# EasyEDA Pro project 电脑鼠_数字量最终方案.eprj, board PCB1
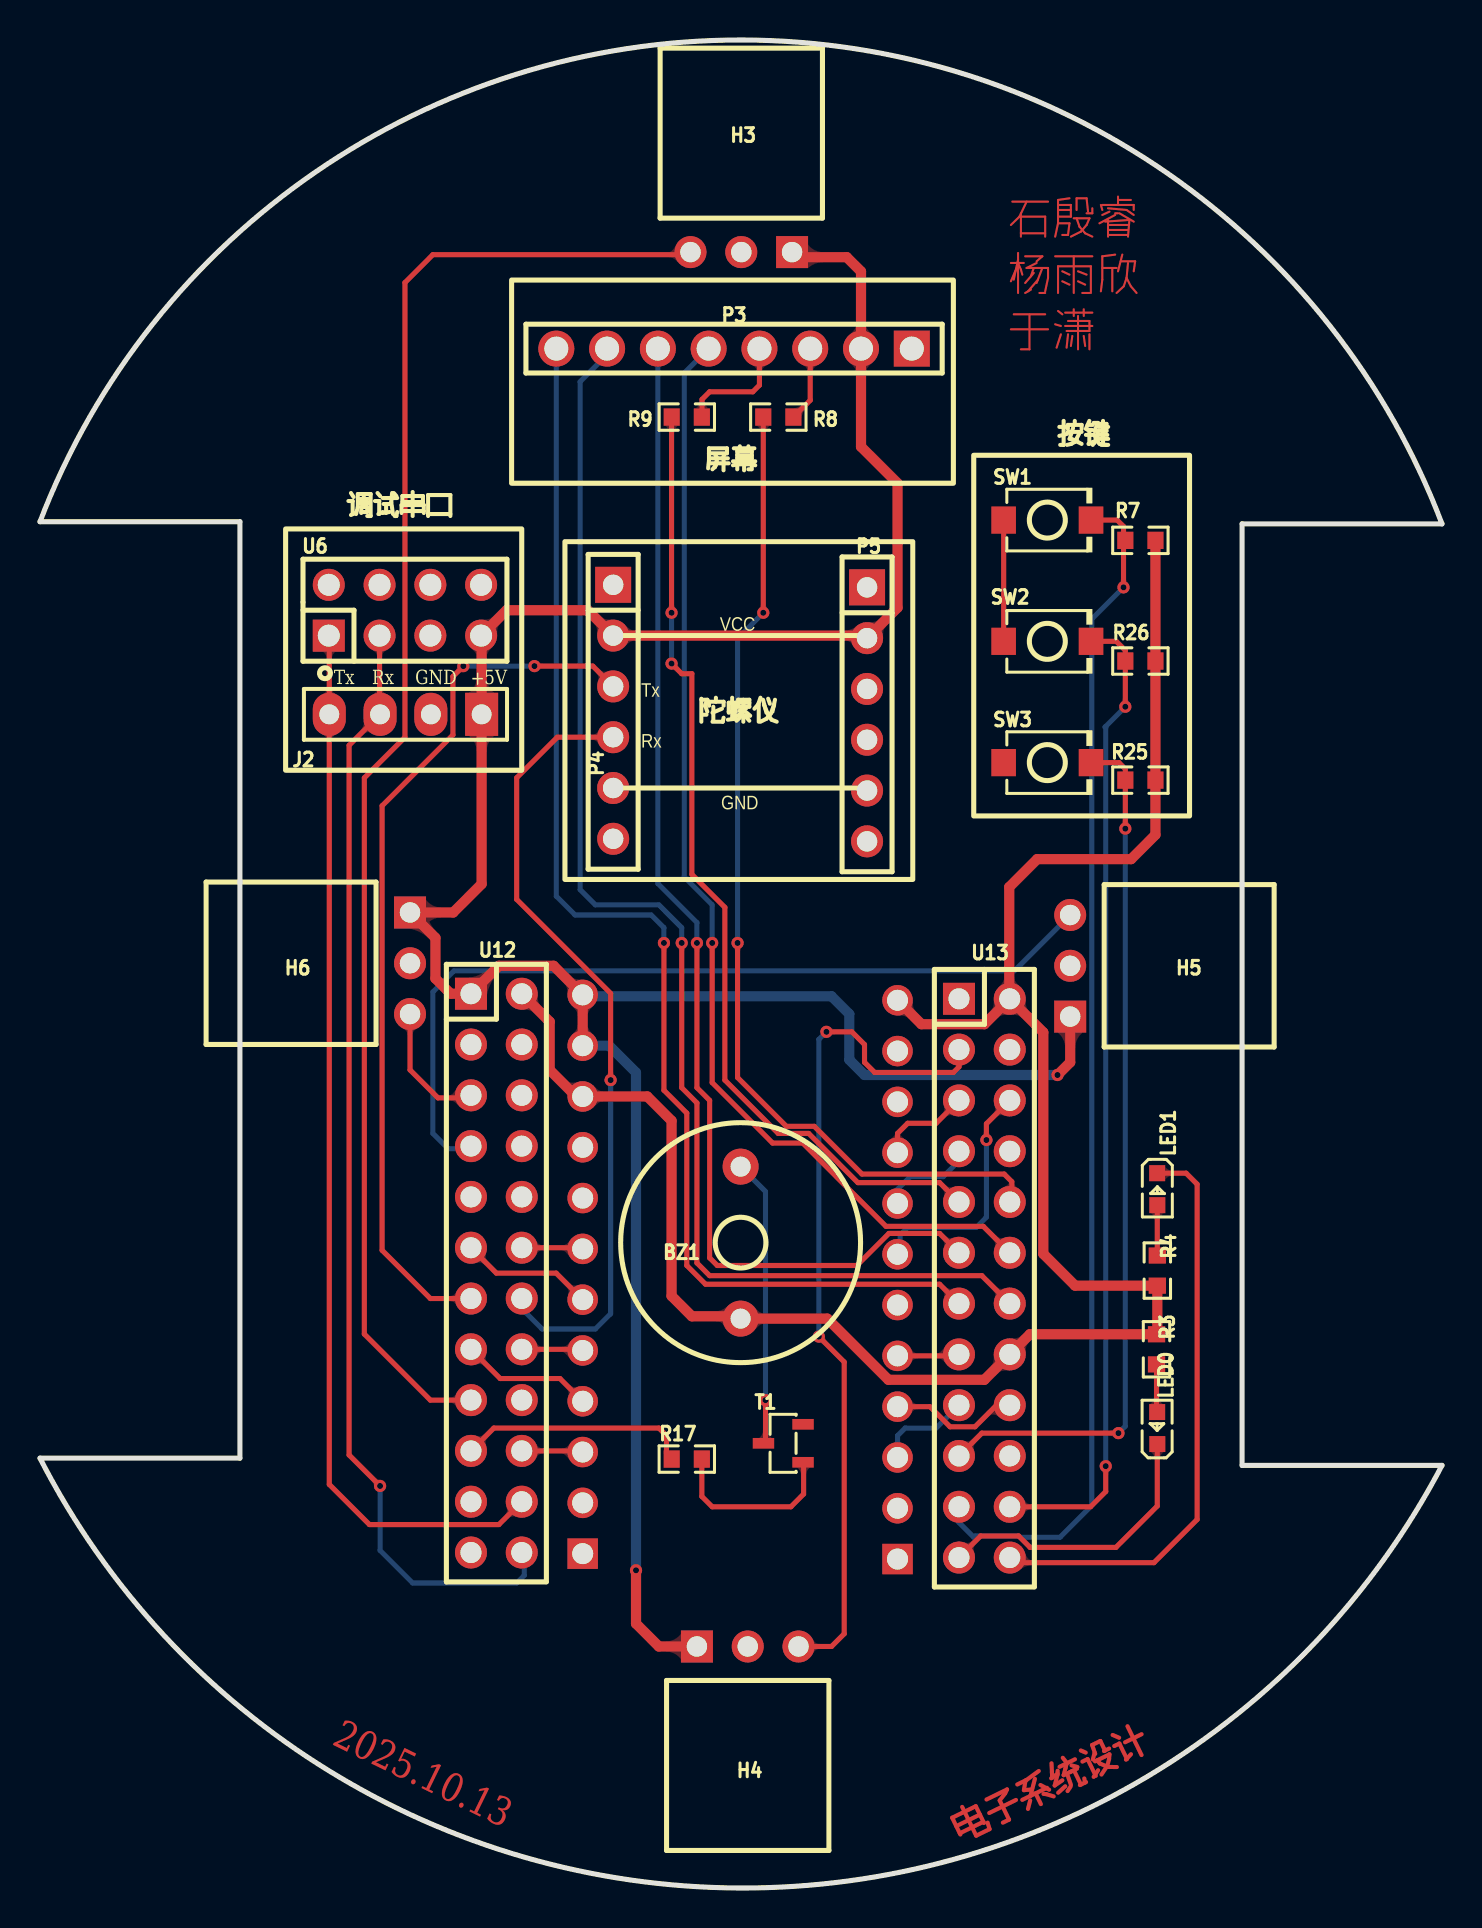
[diagram p2: board, top side]
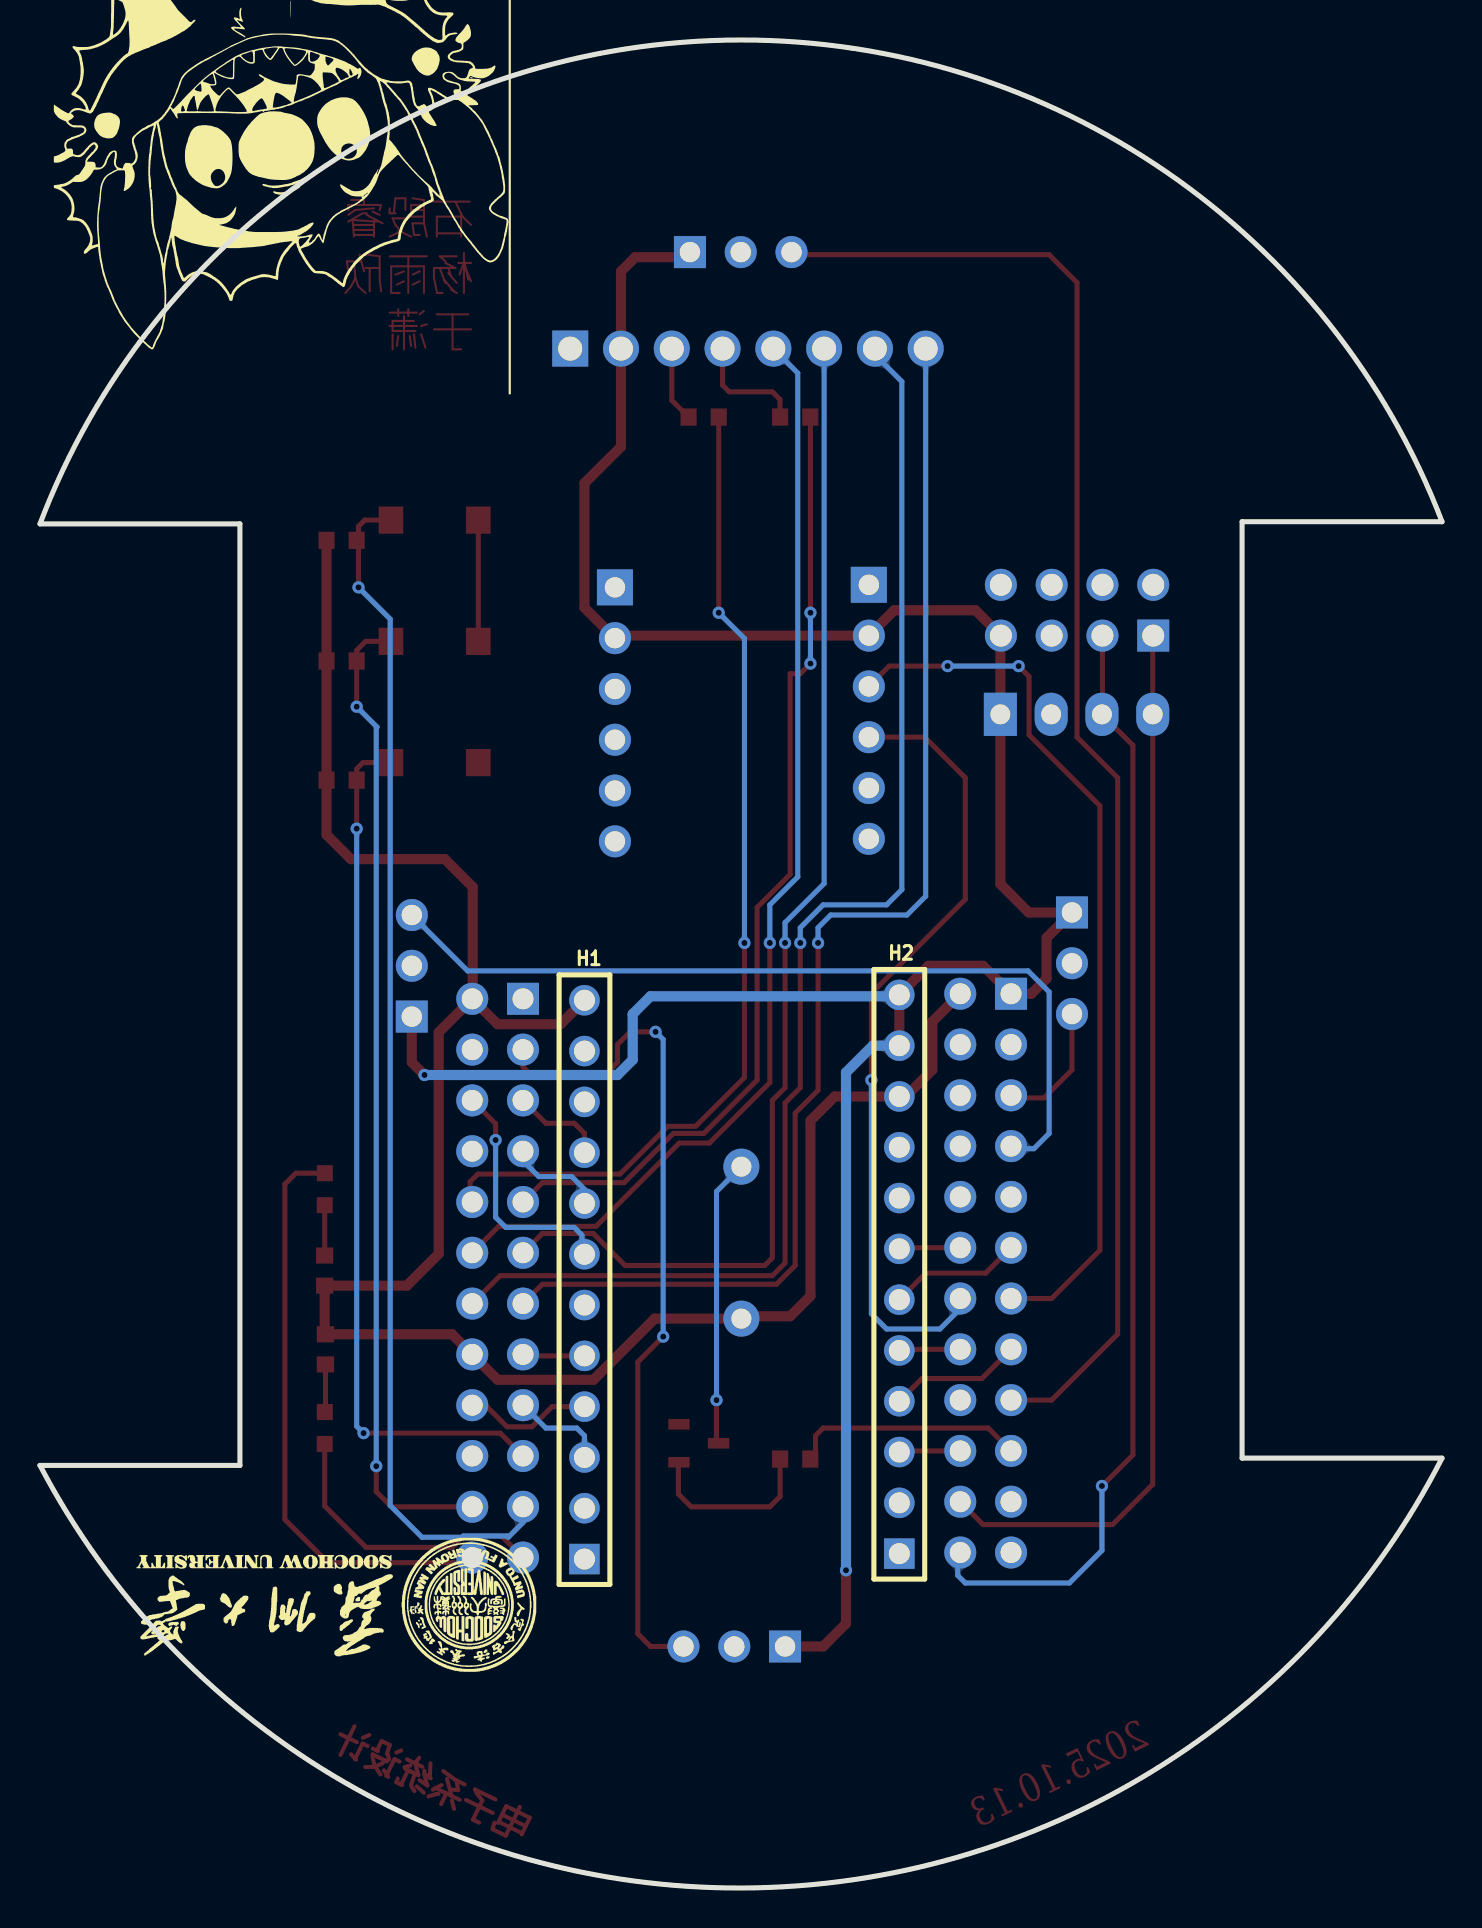
[diagram p3: board, bottom side, seen from below]

Outline 70.13 x 92.41 mm; copper layers: Top Layer, Bottom Layer. Coordinates in mm from the lower left corner of the outline.
Outline path: 0,68.32 arc(35.1,92.41) 70.13,68.21 60.13,68.21 60.13,21.13 70.13,21.13 arc(34.95,0) 0,21.49 10,21.49 10,68.32 0,68.32
Stack: Top Layer 0.035mm / Dielectric1 1.51mm FR4 er 4.5 / Bottom Layer 0.035mm

## Design rules (mm)
template: 自定义配置
spacing copperThickness1oz (default): track to track 0.102, other pairs 0.152 to 0.3
spacing copperThickness2oz: track to track 0.203, other pairs 0.152 to 0.3
track width copperThickness1oz (default): min 0.127, default 0.254, max 2.54
track width copperThickness2oz: min 0.381, default 0.381, max 2.54
differential pair differentialPair (default): width min 0.127, default 0.254, max 2.54; gap min 0.152, default 0.152
via viaSize (default): diameter min 0.5, default 0.61, max 10; hole min 0.3, default 0.305, max 6.299
net +5V uses copperThickness2oz
net 3V3 uses copperThickness2oz

## Placement (name value [footprint] x y rotation side)
BZ1  2.7kHz  [BUZ-TH_BD12.0-P7.60-D0.6-FD]  35.04 32.27 90 top
H1  -  [HDR-TH_12P-P2.54-V-M]  42.89 30.42 90 bottom
H2  -  [HDR-TH_12P-P2.54-V-M]  27.14 30.69 90 bottom
H3  HC-PM254-8.5H-1x3PW-02A  [HDR-TH_3P-P2.54_HC-PM254-8.5H-1X3PW]  35.08 81.8 180 top
H4  HC-PM254-8.5H-1x3PW-02A  [HDR-TH_3P-P2.54_HC-PM254-8.5H-1X3PW]  35.4 12.08 0 top
H5  HC-PM254-8.5H-1x3PW-02A  [HDR-TH_3P-P2.54_HC-PM254-8.5H-1X3PW]  51.53 46.11 90 top
H6  HC-PM254-8.5H-1x3PW-02A  [HDR-TH_3P-P2.54_HC-PM254-8.5H-1X3PW]  18.51 46.24 270 top
J2  null  [HEADER1X4]  18.28 58.56 180 top
LED0  XL-1608SURC-06  [LED0603-RD_RED]  55.88 23 90 top
LED1  XL-1608SURC-06  [LED0603-RD_RED]  55.88 34.94 270 top
P3  null  [HDR-TH_8P-P2.54-V-F-1]  34.72 76.97 180 top
P4  2.54-1*6P母  [HDR-TH_6P-P2.54-V-F]  28.67 58.81 270 top
P5  2.54-1*6P母  [HDR-TH_6P-P2.54-V-F]  41.37 58.69 270 top
R3  4.7kΩ  [R0603]  55.85 26.94 270 top
R4  4.7kΩ  [R0603]  55.89 30.87 90 top
R7  4.7kΩ  [R0603]  55.04 67.39 0 top
R8  100Ω  [R0603]  36.93 73.55 180 top
R9  100Ω  [R0603]  32.35 73.55 180 top
R17  100Ω  [R0603]  32.35 21.45 0 top
R25  4.7kΩ  [R0603]  55.04 55.4 0 top
R26  4.7kΩ  [R0603]  55.04 61.35 0 top
SW1  TS-1088-AR02016  [SW-SMD_L3.9-W3.0-P4.45]  50.39 68.4 0 top
SW2  TS-1088-AR02016  [SW-SMD_L3.9-W3.0-P4.45]  50.39 62.34 0 top
SW3  TS-1088-AR02016  [SW-SMD_L3.9-W3.0-P4.45]  50.39 56.27 0 top
T1  S8050  [SOT-23-3_L2.9-W1.3-P1.90-LS2.3-BR]  37.18 22.24 0 top
U6  null  [HDR-TH_8P-P2.54-V-F-R2-C4-S2.54-1]  18.26 63.89 0 top
U12  null  [HDR-TH_24P-P2.54-V-F-R2-C12-S2.54-2]  22.83 30.75 270 top
U13  null  [HDR-TH_24P-P2.54-V-F-R2-C12-S2.54-2]  47.24 30.49 270 top

## Footprints (pads in the part's own frame, mm; a bottom-side part is the same pattern mirrored in y, then rotated)
BUZ-TH_BD12.0-P7.60-D0.6-FD
  round 1.8 hole 1: 1(-3.8,0) 2(3.8,0)
HDR-TH_3P-P2.54_HC-PM254-8.5H-1X3PW
  rect 1.6x1.6 hole 1.02: 1(-2.54,0)
  round 1.6 hole 1.02: 2(0,0) 3(2.54,0)
HDR-TH_6P-P2.54-V-F
  rect 1.8x1.8 hole 1.02: 1(-6.35,0)
  round 1.6 hole 1.02: 2(-3.81,0) 3(-1.27,0) 4(1.27,0) 5(3.81,0) 6(6.35,0)
HDR-TH_8P-P2.54-V-F-1
  rect 1.8x1.8 hole 1.2: 1(-8.89,0)
  round 1.8 hole 1.2: 2(-6.35,0) 3(-3.81,0) 4(-1.27,0) 5(1.27,0) 6(3.81,0) 7(6.35,0) 8(8.89,0)
HDR-TH_8P-P2.54-V-F-R2-C4-S2.54-1
  rect 1.6x1.6 hole 1.1: 1(-3.81,-1.27)
  round 1.6 hole 1.1: 2(-3.81,1.27) 3(-1.27,-1.27) 4(-1.27,1.27) 5(1.27,-1.27) 6(1.27,1.27) 7(3.81,-1.27) 8(3.81,1.27)
HDR-TH_12P-P2.54-V-M
  rect 1.524x1.524 hole 1.05: 1(-13.97,0)
  round 1.524 hole 1.05: 2(-11.43,0) 3(-8.89,0) 4(-6.35,0) 5(-3.81,0) 6(-1.27,0) 7(1.27,0) 8(3.81,0) 9(6.35,0) 10(8.89,0) 11(11.43,0) 12(13.97,0)
HDR-TH_24P-P2.54-V-F-R2-C12-S2.54-2
  rect 1.6x1.6 hole 1.05: 1(-13.97,-1.27)
  round 1.6 hole 1.05: 2(-13.97,1.27) 3(-11.43,-1.27) 4(-11.43,1.27) 5(-8.89,-1.27) 6(-8.89,1.27) 7(-6.35,-1.27) 8(-6.35,1.27) 9(-3.81,-1.27) 10(-3.81,1.27) 11(-1.27,-1.27) 12(-1.27,1.27) 13(1.27,-1.27) 14(1.27,1.27) 15(3.81,-1.27) 16(3.81,1.27) 17(6.35,-1.27) 18(6.35,1.27) 19(8.89,-1.27) 20(8.89,1.27) 21(11.43,-1.27) 22(11.43,1.27) 23(13.97,-1.27) 24(13.97,1.27)
HEADER1X4
  rect 1.651x2.159 hole 0.991x0.996: 1(-3.81,-0.127)
  oval 1.651x2.159 hole 0.991x0.996: 2(-1.27,-0.127) 3(1.27,-0.127) 4(3.81,-0.127)
LED0603-RD_RED
  rect 0.8x0.8 smd: 1(-0.799,-0.004) 2(0.799,0.004)
R0603
  rect 0.806x0.864 smd: 1(-0.753,0) 2(0.753,0)
SOT-23-3_L2.9-W1.3-P1.90-LS2.3-BR
  rect 1.07x0.532 smd: 1(0.99,-0.95) 2(0.99,0.95) 3(-0.99,0)
SW-SMD_L3.9-W3.0-P4.45
  rect 1.23x1.36 smd: 1(-2.185,0) 2(2.185,0)

## Nets
As in the schematic.

Pads without a net: P4 1 6; P5 1 3 4 6; U6 2 4 8

## Via types
v1: diameter 0.61, hole 0.305, Top Layer to Bottom Layer, 23 vias

## Routing (per net, layer and track width the routed paths; a pad name or vN(x,y) marks a point on that pad's centre or on a via; arc(x,y) is an arc through that point)
3V3: length 104.8
  Top Layer w0.508: U13.2 50.18,42.79 50.18,31.71 51.77,30.12 R4.1 55.89,27.73 R3.1 49.51,27.69 U13.16 47.24,25.41 42.44,25.41 39.38,28.47 BZ1.1 34.93,28.59 32.61,28.59 31.59,29.6 31.59,38.37 30.38,39.58 H2.10 26.82,39.58 25.49,40.91 25.49,43.32 U12.2 ; U13.2 48.48,44.49 48.48,50.05 49.88,51.45 54.58,51.45 55.79,52.66 R25.2 R26.2 R7.2 ; U13.2 47.24,43.19 44.09,43.19 H1.12
+5V: length 140
  Top Layer w0.508: v1(29.81,15.89) 29.81,13.22 30.95,12.08 32.86,12.08 ; H2.11 H2.12 25.69,46.11 22.95,46.11 U12.1 20.54,44.72 19.78,45.48 19.78,47.51 H6.1 20.67,48.78 22.09,50.2 J2.1 22.09,62.6 U6.7 23.33,63.89 27.4,63.89 P4.2 41.24,62.62 P5.2 42.89,64.02 42.89,70.24 41.07,72.07 41.07,80.83 40.35,81.55 37.87,81.55 H3.1 ; H5.1 51.53,41.29 v1(50.89,40.65)
  Bottom Layer w0.508: H2.11 28.47,42.12 29.81,40.78 v1(29.81,15.89) ; v1(50.89,40.65) 41.24,40.65 40.48,41.41 40.48,43.7 39.59,44.59 27.22,44.59 H2.12
GND: length 6.1
  Top Layer w0.254: SW1.1 SW2.1
BAT_ADC: length 3.1
  Top Layer w0.254: U12.20 27.09,21.86 H2.3
BEEP: length 11.7
  Top Layer w0.254: U12.19 22.7,23 30.95,23 31.34,22.62 31.34,21.71 R17.1
DETECT0: length 75
  Top Layer w0.254: H3.3 32.41,81.67 19.65,81.67 18.26,80.28 18.26,57.54 16.22,55.51 16.22,27.7 19.53,24.4 U12.17
DETECT1: length 42.3
  Top Layer w0.254: v1(38.96,27.57) 40.23,26.3 40.23,12.71 39.59,12.08 H4.3 ; 45.97,41.92 45.97,41.06 45.69,40.78 41.75,40.78 41.24,41.29 41.24,42.18 40.61,42.81 v1(39.34,42.81)
  Bottom Layer w0.254: v1(39.34,42.81) 38.96,42.43 v1(38.96,27.57)
DETECT2: length 42.8
  Bottom Layer w0.254: 21.56,37.1 21.43,36.97 20.41,36.97 19.65,37.73 19.65,44.81 20.7,45.86 48.73,45.86 H5.3
DETECT3: length 6.5
  Top Layer w0.254: U12.5 21.43,39.51 19.91,39.51 18.51,40.91 18.51,43.7
DIR_L1: length 3.1
  Top Layer w0.254: H1.5 45.89,26.61 U13.15
DIR_L2: length 6.5
  Top Layer w0.254: H1.4 44.51,24.07 45.52,23.06 46.77,23.06 47.85,24.14 48.51,24.14
DIR_R1: length 11.8
  Top Layer w0.254: 47.34,37.6 47.34,38.21 U13.6
  Bottom Layer w0.254: H1.7 43.02,31.82 43.02,32.65 43.4,33.03 46.83,33.03 47.34,33.54 v1(47.34,37.4)
DIR_R2: length 4.9
  Bottom Layer w0.254: U13.7 45.97,36.36 45.18,35.57 43.53,35.57 42.89,34.94 H1.8
ENC_LA: length 3.1
  Top Layer w0.254: H2.5 27.09,26.94 U12.16
ENC_LB: length 6.7
  Top Layer w0.254: H2.4 26.01,25.48 23.02,25.48 U12.15
ENC_RA: length 3.1
  Top Layer w0.254: 24.1,32.02 27.09,32.02 H2.7
ENC_RB: length 6.7
  Top Layer w0.254: 21.56,32.02 22.83,30.75 25.82,30.75 H2.6
IMU_RX1: length 40.1
  Top Layer w0.254: P4.4 25.88,57.54 23.84,55.51 23.84,49.43 28.54,44.73 v1(28.54,40.4)
  Bottom Layer w0.254: U12.14 24.1,28.97 25.11,27.95 27.78,27.95 28.54,28.71 v1(28.54,40.4)
IMU_TX1: length 44.3
  Top Layer w0.254: P4.3 27.65,61.1 v1(24.73,61.1) ; U12.13 19.53,29.48 17.11,31.89 17.11,54.11 20.66,57.66 20.66,60.58 v1(21.18,61.1)
  Bottom Layer w0.254: v1(21.18,61.1) v1(24.73,61.1)
KEY0: length 59.9
  Top Layer w0.254: v1(54.2,65.04) 54.2,67.3 R7.1 54.2,67.48 54.2,68.08 53.88,68.4 SW1.2
  Bottom Layer w0.254: v1(54.2,65.04) 52.61,63.45 52.61,19.13 51.02,17.54 49.02,17.54 48.95,17.6 46.77,17.6 46.7,17.54 45.97,18.27 U13.21
KEY1: length 49.5
  Top Layer w0.254: v1(54.29,59.07) R26.1 54.29,61.88 53.83,62.34 SW2.2 ; U13.22 52.55,19.06 53.31,19.82 v1(53.31,21.09)
  Bottom Layer w0.254: v1(53.31,21.09) 53.31,58.01 53.27,58.05 v1(54.29,59.07)
KEY2: length 43.7
  Top Layer w0.254: U13.19 47.11,22.74 v1(53.94,22.74) ; SW3.2 53.97,56.27 54.29,55.96 R25.1 v1(54.29,52.97)
  Bottom Layer w0.254: v1(53.94,22.74) 54.29,23.09 v1(54.29,52.97)
LED0: length 14.6
  Top Layer w0.254: U13.23 47.05,17.6 48.95,17.6 49.53,17.03 53.82,17.03 55.89,19.1 LED0.1
LED1: length 29.4
  Top Layer w0.254: LED1.1 57.33,35.74 57.88,35.19 57.88,18.43 55.72,16.27 48.76,16.27 U13.24
OLED_BLK: length 65.2
  Top Layer w0.254: 45.97,29.22 45,30.19 33.29,30.19 32.35,31.13 32.35,38.75 31.21,39.89 v1(31.21,47.26)
  Bottom Layer w0.254: 25.83,76.97 25.83,49.59 26.76,48.65 30.57,48.65 31.21,48.02 v1(31.21,47.26)
OLED_CS: length 67
  Top Layer w0.254: 48.51,29.22 47.11,30.62 33.5,30.62 32.86,31.25 32.86,39.25 32.1,40.02 v1(32.1,47.26)
  Bottom Layer w0.254: v1(32.1,47.26) 32.1,48.02 30.95,49.16 27.78,49.16 27.02,49.92 27.02,75.32 28.37,76.67 P3.7
OLED_DC: length 60.2
  Top Layer w0.254: U13.11 45,32.73 42.46,32.73 40.86,31.13 33.88,31.13 33.5,31.51 33.5,39.38 32.86,40.02 v1(32.86,47.26)
  Bottom Layer w0.254: 30.91,76.97 30.91,50.23 32.86,48.27 v1(32.86,47.26)
OLED_RST: length 56.2
  Top Layer w0.254: U13.12 47.18,33.09 42.31,33.09 38.15,37.25 36.64,37.25 33.62,40.27 v1(33.62,47.26)
  Bottom Layer w0.254: v1(33.62,47.26) 33.62,49.16 32.23,50.56 32.23,75.75 33.45,76.97
OLED_SCL: length 50.5
  Top Layer w0.254: v1(34.89,47.26) 34.89,40.52 37.33,38.09 38.73,38.09 41.11,35.7 48.23,35.7 48.61,35.32 48.61,34.4 U13.10 ; 36.18,73.55 v1(36.18,63.77)
  Bottom Layer w0.254: v1(34.89,47.26) 34.89,62.48 v1(36.18,63.77)
OLED_SDA: length 48.8
  Top Layer w0.254: R9.2 31.59,73.54 v1(31.59,63.77) ; U13.9 45,35.27 40.91,35.27 38.45,37.73 36.92,37.73 34.26,40.4 34.26,49.03 32.61,50.68 32.61,60.72 32.1,60.72 v1(31.59,61.23)
  Bottom Layer w0.254: v1(31.59,63.77) v1(31.59,61.23)
PWM_L: length 4.8
  Bottom Layer w0.254: 45.97,24.14 44.82,23 43.27,23 42.89,22.62 H1.3
PWM_R: length 4.7
  Top Layer w0.254: U13.5 44.82,38.24 43.4,38.24 42.89,37.73 H1.9
RX: length 56.3
  Top Layer w0.254: 16.98,20.08 v1(17.01,20.1) 15.46,21.65 15.46,57.14 J2.3 16.98,58.71 U6.3
  Bottom Layer w0.254: v1(17.01,20.1) 17.01,16.88 18.64,15.25 23.84,15.25 24.22,15.63 24.22,16.65 U12.24
TX: length 53.4
  Top Layer w0.254: 24.1,19.32 22.95,18.17 16.48,18.17 14.47,20.18 J2.4 14.47,62.6 U6.1
$1N2633: length 9
  Top Layer w0.254: T1.1 38.19,21.26 38.19,19.7 37.56,19.06 33.62,19.06 33.11,19.58 R17.2
$1N2636: length 14.4
  Top Layer w0.254: v1(36.29,24.4) 36.29,22.34 T1.3
  Bottom Layer w0.254: BZ1.2 36.29,34.82 v1(36.29,24.4)
$1N2649: length 3.8
  Top Layer w0.254: R8.1 38.53,74.39 P3.3
$1N2650: length 5.9
  Top Layer w0.254: R9.1 33.11,73.56 33.11,74.43 33.5,74.81 35.65,74.81 35.99,75.15 P3.4
$1N2827: length 2.4
  Top Layer w0.254: LED0.2 55.85,23.83 R3.2
$1N2828: length 2.5
  Top Layer w0.254: LED1.2 55.89,31.63 R4.2

## Copper pours and planes (outline as drawn; the poured copper is in the pictures)
GND on Top Layer: -14,97.67 97.5,97.67 97.5,-7.99 -14,-7.99
GND on Bottom Layer: -10.19,95.52 91.53,95.52 91.53,-4.05 -10.19,-4.05

Small or netless copper shapes (teardrops, artwork), in the pictures only: 107 on Top Layer, 38 on Bottom Layer

## Text on the board
Top Layer: 2025.10.13 | 电子系统设计 | 石殷睿 / 杨雨欣 / 于潇
Top Solder Mask Layer: 2025.10.13 | 电子系统设计 | 石殷睿 / 杨雨欣 / 于潇
Top Silkscreen Layer: Tx | Rx | VCC | GND | +5V | 调试串口 | 陀螺仪 | 屏幕 | 按键
